# Altium schematic sheet Power_Input_5V.SchDoc: 01 - Entrada protegida e fonte digital
size A3; Project: CM5 Photonic Bias Controller; DocumentRev: R5; ProjectRev: R5; Version: Rev R6; SheetNumber: 2; SheetTotal: 17; Author: Carlos Renan; SCH_SCALE: N/A; Address1: UFCG; Address2: Referencia: VIRTUS CC; Address3: Campina Grande - PB; ProjectName: Controle automatico de BIAS para MZM/IQ - Projeto 3; DocumentName: Power_Input_5V.SchDoc
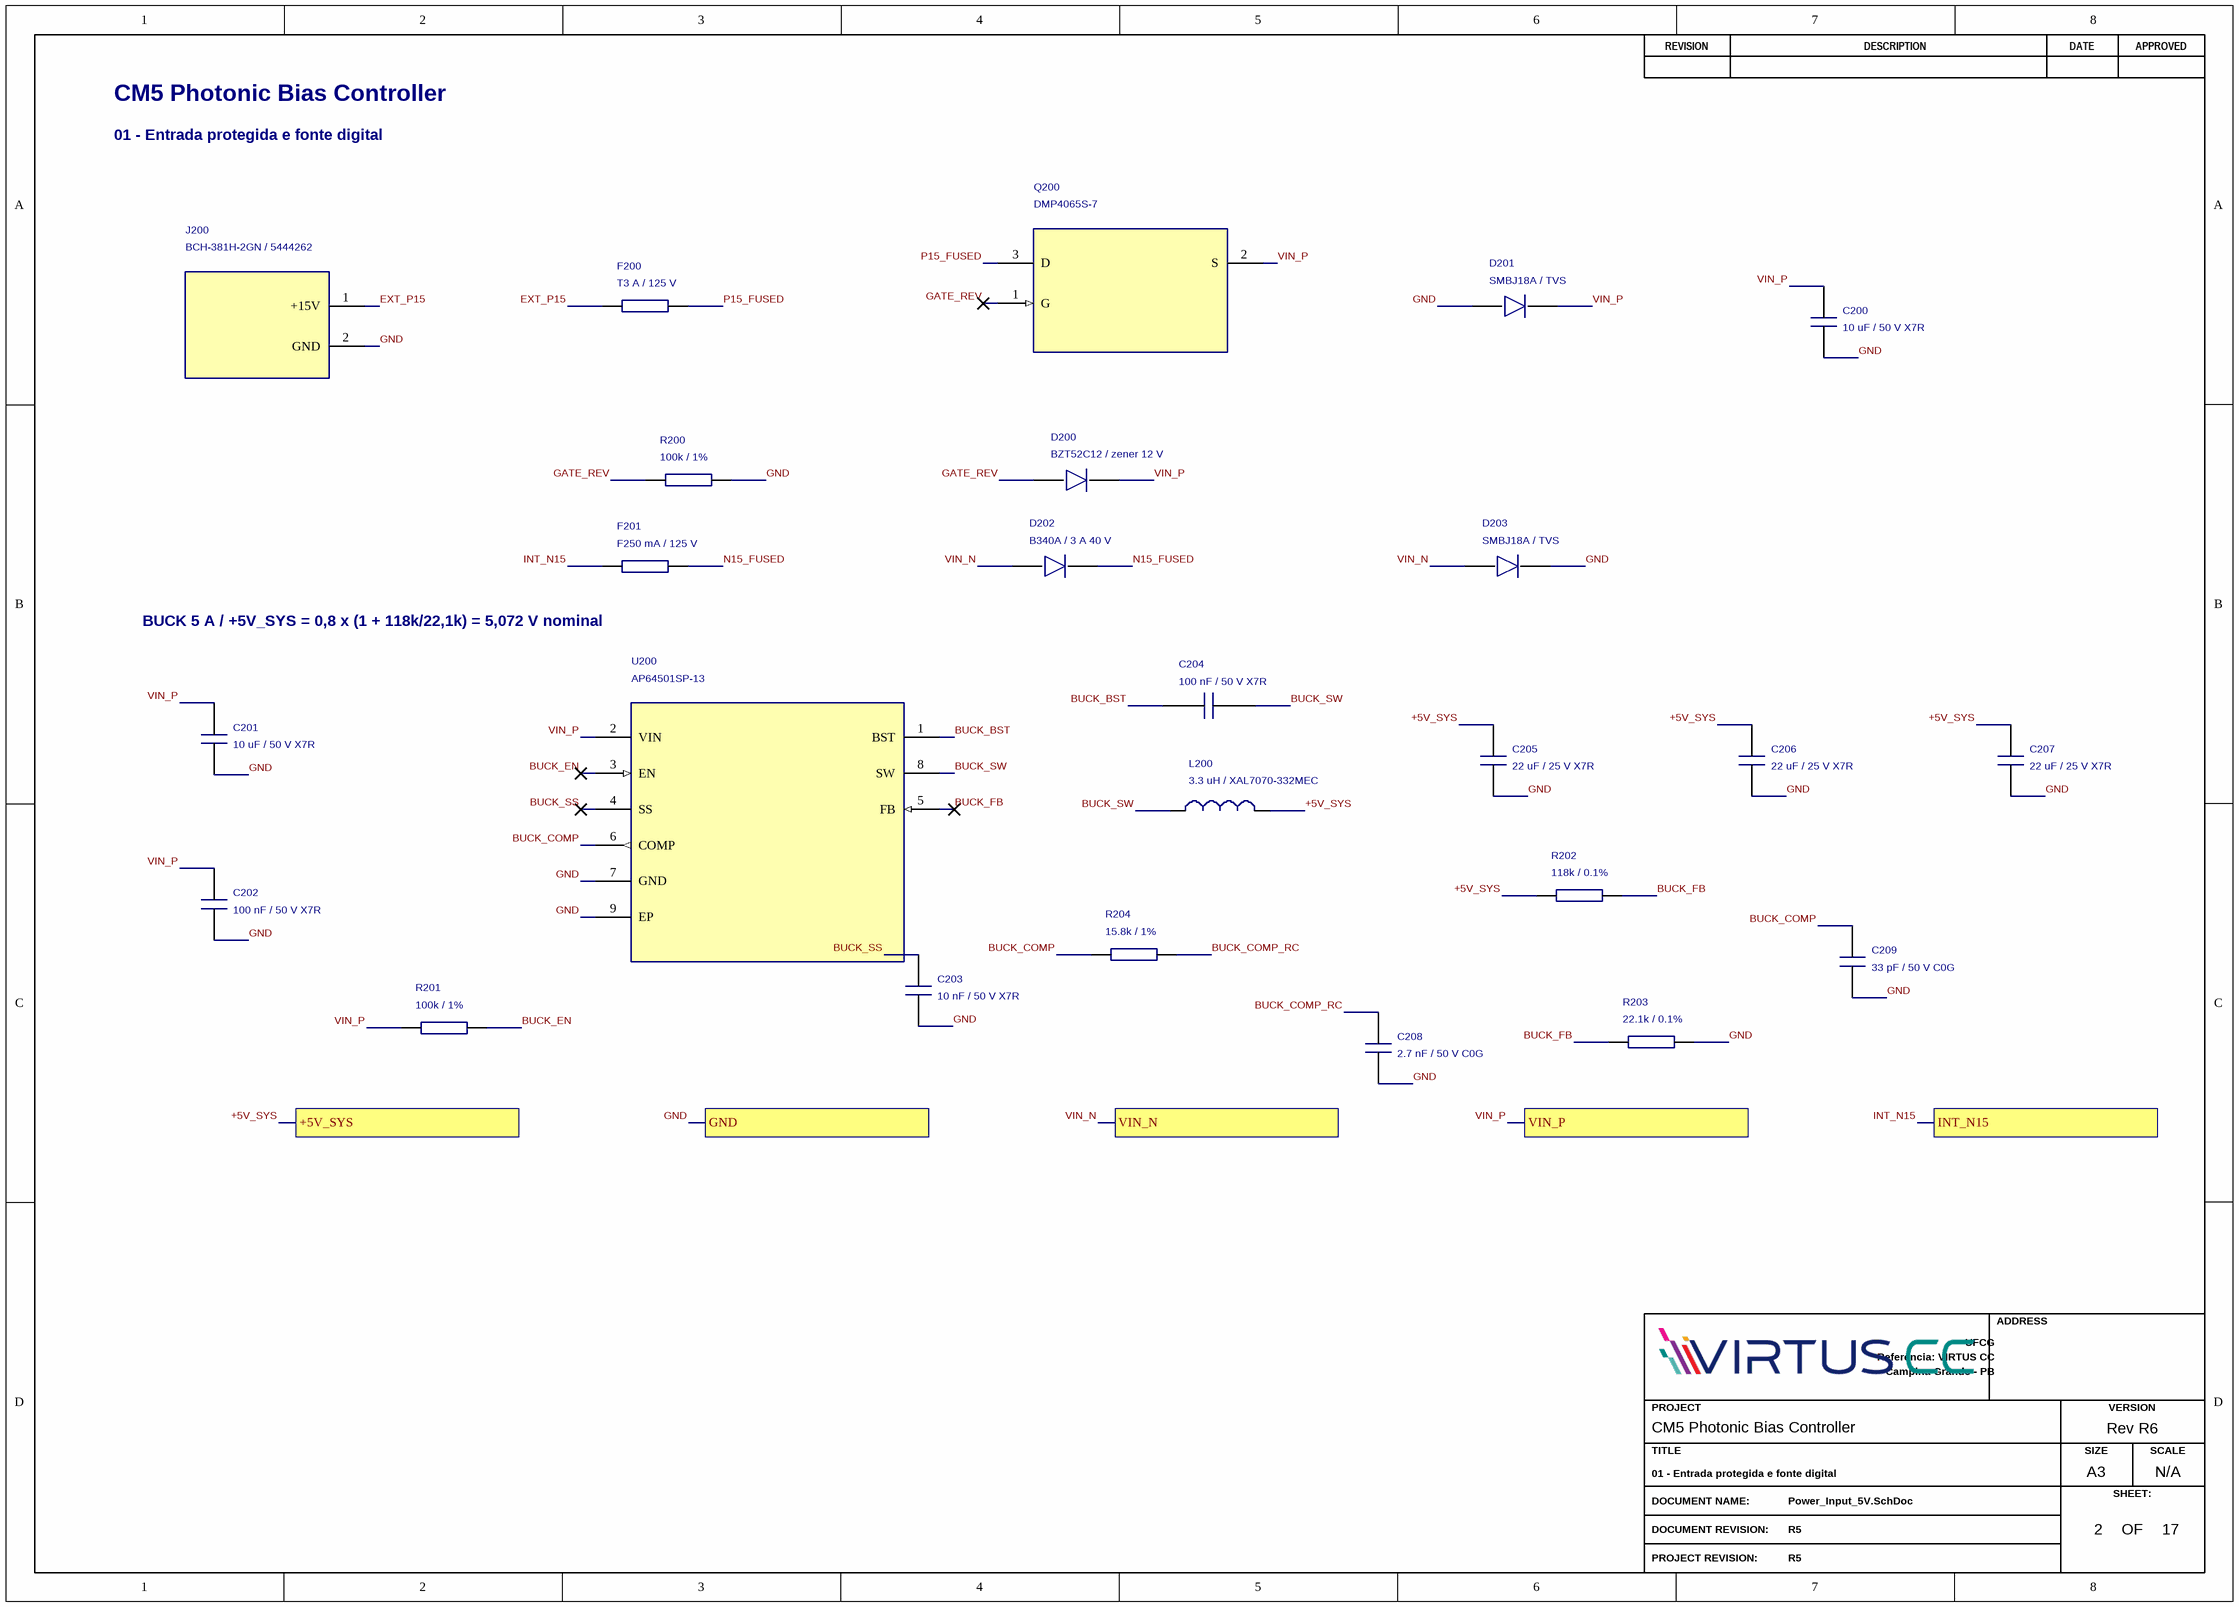
[diagram p0: Power_Input_5V.SchDoc]

## Parts
C200  10 uF / 50 V X7R  [C1210]
C201  10 uF / 50 V X7R  [C1210]
C202  100 nF / 50 V X7R  [C0805]
C203  10 nF / 50 V X7R  [C0805]
C204  100 nF / 50 V X7R  [C0805]
C205  22 uF / 25 V X7R  [C1210]
C206  22 uF / 25 V X7R  [C1210]
C207  22 uF / 25 V X7R  [C1210]
C208  2.7 nF / 50 V C0G  [C0805]
C209  33 pF / 50 V C0G  [C0805]
D200  BZT52C12 / zener 12 V  [SOD-123]
D201  SMBJ18A / TVS  [DO-214AA]
D202  B340A / 3 A 40 V  [DO-214AC]
D203  SMBJ18A / TVS  [DO-214AA]
F200  T3 A / 125 V  [FUSE_NANO2]
F201  F250 mA / 125 V  [FUSE_NANO2]
J200  BCH-381H-2GN / 5444262  [5444262]
L200  3.3 uH / XAL7070-332MEC  [XAL7070]
Q200  DMP4065S-7  [ONSC-SOT-23-3-318-08_V]
R200  100k / 1%  [R-0603]
R201  100k / 1%  [R-0603]
R202  118k / 0.1%  [R-0603]
R203  22.1k / 0.1%  [R-0603]
R204  15.8k / 1%  [R-0603]
U200  AP64501SP-13  [AP64501_SO8EP]

## Ports
+5V_SYS, GND, INT_N15, VIN_N, VIN_P

## Nets
+5V_SYS: C205.1 C206.1 C207.1 L200.2 R202.1 ; port +5V_SYS
BUCK_BST: C204.1 U200.1(BST)
BUCK_COMP: C209.1 R204.1 U200.6(COMP)
BUCK_COMP_RC: C208.1 R204.2
BUCK_EN: R201.2 U200.3(EN)
BUCK_FB: R202.2 R203.1 U200.5(FB)
BUCK_SS: C203.1 U200.4(SS)
BUCK_SW: C204.2 L200.1 U200.8(SW)
EXT_P15: F200.1 J200.1(+15V)
GATE_REV: D200.2(A) Q200.1(G) R200.1
GND: C200.2 C201.2 C202.2 C203.2 C205.2 C206.2 C207.2 C208.2 C209.2 D201.2(A) D203.1(K) J200.2(GND) R200.2 R203.2 U200.7(GND) U200.9(EP) ; port GND
INT_N15: F201.1 ; port INT_N15
N15_FUSED: D202.1(K) F201.2
P15_FUSED: F200.2 Q200.3(D)
VIN_N: D202.2(A) D203.2(A) ; port VIN_N
VIN_P: C200.1 C201.1 C202.1 D200.1(K) D201.1(K) Q200.2(S) R201.1 U200.2(VIN) ; port VIN_P

## Notes on the sheet
- CM5 Photonic Bias Controller
- 01 - Entrada protegida e fonte digital
- (near F201) BUCK 5 A / +5V_SYS = 0,8 x (1 + 118k/22,1k) = 5,072 V nominal
- REVISION
- DESCRIPTION
- DATE
- APPROVED
- ADDRESS
- PROJECT
- VERSION
- TITLE
- A3
- SIZE
- SCALE
- DOCUMENT NAME:
- DOCUMENT REVISION:
- OF
- SHEET:
- PROJECT REVISION:

## Library data of the parts
C200 = 22 uF: Manufacturer: KEMET; Manufacturer Part Number: C1210C106K5RACTU; Review: 10 uF/50 V + C201 de 10 uF substituem a combinacao generica 22+10 uF na entrada; verificar ripple/inrush.; Procurement Status: Busca por MPN; SKU e disponibilidade a confirmar; BOM Purchase: Yes; Manufacturer 1: KEMET; Manufacturer Part Number 1: C1210C106K5RACTU; Supplier 1: DigiKey; Supplier URL 1: https://www.digikey.com.br/pt/products/result?keywords=C1210C106K5RACTU; Supplier 2: Mouser; Supplier URL 2: https://br.mouser.com/c/?q=C1210C106K5RACTU; Datasheet: https://www.yageogroup.com/download/specsheet/C1210C106K5RACTU
C201 = 10 uF: Manufacturer: KEMET; Manufacturer Part Number: C1210C106K5RACTU; Procurement Status: Busca por MPN; SKU e disponibilidade a confirmar; BOM Purchase: Yes; Manufacturer 1: KEMET; Manufacturer Part Number 1: C1210C106K5RACTU; Supplier 1: DigiKey; Supplier URL 1: https://www.digikey.com.br/pt/products/result?keywords=C1210C106K5RACTU; Supplier 2: Mouser; Supplier URL 2: https://br.mouser.com/c/?q=C1210C106K5RACTU; Datasheet: https://www.yageogroup.com/download/specsheet/C1210C106K5RACTU
C202 C204 = 100 nF: Manufacturer: KEMET; Manufacturer Part Number: C0805C104K5RACTU; Procurement Status: Busca por MPN; SKU e disponibilidade a confirmar; BOM Purchase: Yes; Manufacturer 1: KEMET; Manufacturer Part Number 1: C0805C104K5RACTU; Supplier 1: DigiKey; Supplier URL 1: https://www.digikey.com.br/pt/products/result?keywords=C0805C104K5RACTU; Supplier 2: Mouser; Supplier URL 2: https://br.mouser.com/c/?q=C0805C104K5RACTU; Datasheet: https://www.yageogroup.com/download/specsheet/C0805C104K5RACTU
C203 = 10 nF: Manufacturer: KEMET; Manufacturer Part Number: C0805C103K5RACTU; Procurement Status: Busca por MPN; SKU e disponibilidade a confirmar; BOM Purchase: Yes; Manufacturer 1: KEMET; Manufacturer Part Number 1: C0805C103K5RACTU; Supplier 1: DigiKey; Supplier URL 1: https://www.digikey.com.br/pt/products/result?keywords=C0805C103K5RACTU; Supplier 2: Mouser; Supplier URL 2: https://br.mouser.com/c/?q=C0805C103K5RACTU; Datasheet: https://www.yageogroup.com/download/specsheet/C0805C103K5RACTU
C205-C207 = 22 uF: Manufacturer: KEMET; Manufacturer Part Number: C1210C226K3RACTU; Review: Confirmar curva DC-bias: meta de >=50 uF efetivos no conjunto a 5,1 V; compensacao do buck ainda requer ensaio.; Procurement Status: SKU conferido; consultar disponibilidade; BOM Purchase: Yes; Manufacturer 1: KEMET; Manufacturer Part Number 1: C1210C226K3RACTU; Supplier 1: DigiKey; Supplier Part Number 1: 399-C1210C226K3RACTUCT-ND; Supplier URL 1: https://www.digikey.com/en/products/detail/kemet/C1210C226K3RACTU/5267618; Supplier 2: Mouser; Supplier URL 2: https://br.mouser.com/c/?q=C1210C226K3RACTU; Datasheet: https://www.yageogroup.com/download/specsheet/C1210C226K3RACTU
C208 = 2.7 nF: Manufacturer: KEMET; Manufacturer Part Number: C0805C272J5GACTU; Procurement Status: Busca por MPN; SKU e disponibilidade a confirmar; BOM Purchase: Yes; Manufacturer 1: KEMET; Manufacturer Part Number 1: C0805C272J5GACTU; Supplier 1: DigiKey; Supplier URL 1: https://www.digikey.com.br/pt/products/result?keywords=C0805C272J5GACTU; Supplier 2: Mouser; Supplier URL 2: https://br.mouser.com/c/?q=C0805C272J5GACTU; Datasheet: https://www.yageogroup.com/download/specsheet/C0805C272J5GACTU
C209 = 33 pF: Manufacturer: KEMET; Manufacturer Part Number: C0805C330J5GACTU; Procurement Status: Busca por MPN; SKU e disponibilidade a confirmar; BOM Purchase: Yes; Manufacturer 1: KEMET; Manufacturer Part Number 1: C0805C330J5GACTU; Supplier 1: DigiKey; Supplier URL 1: https://www.digikey.com.br/pt/products/result?keywords=C0805C330J5GACTU; Supplier 2: Mouser; Supplier URL 2: https://br.mouser.com/c/?q=C0805C330J5GACTU; Datasheet: https://www.yageogroup.com/download/specsheet/C0805C330J5GACTU
D200 = BZT52C12: Manufacturer: Diodes Incorporated; Manufacturer Part Number: BZT52C12-7-F; Procurement Status: Busca por MPN; SKU e disponibilidade a confirmar; BOM Purchase: Yes; Manufacturer 1: Diodes Incorporated; Manufacturer Part Number 1: BZT52C12-7-F; Supplier 1: DigiKey; Supplier URL 1: https://www.digikey.com.br/pt/products/result?keywords=BZT52C12-7-F; Supplier 2: Mouser; Supplier URL 2: https://br.mouser.com/c/?q=BZT52C12-7-F; Datasheet: https://www.diodes.com/datasheet/download/BZT52C2V4.pdf
D201 D203 = SMBJ18A: Manufacturer: Diodes Incorporated; Manufacturer Part Number: SMBJ18A-13-F; Procurement Status: Busca por MPN; SKU e disponibilidade a confirmar; BOM Purchase: Yes; Manufacturer 1: Diodes Incorporated; Manufacturer Part Number 1: SMBJ18A-13-F; Supplier 1: DigiKey; Supplier URL 1: https://www.digikey.com.br/pt/products/result?keywords=SMBJ18A-13-F; Supplier 2: Mouser; Supplier URL 2: https://br.mouser.com/c/?q=SMBJ18A-13-F; Datasheet: https://www.diodes.com/datasheet/download/SMBJ5.0A.pdf
D202 = SS34: Manufacturer: Diodes Incorporated; Manufacturer Part Number: B340A-13-F; Review: Substitui SS34 generico; encapsulamento SMA definido pelo fabricante.; Procurement Status: Busca por MPN; SKU e disponibilidade a confirmar; BOM Purchase: Yes; Manufacturer 1: Diodes Incorporated; Manufacturer Part Number 1: B340A-13-F; Supplier 1: DigiKey; Supplier URL 1: https://www.digikey.com.br/pt/products/result?keywords=B340A-13-F; Supplier 2: Mouser; Supplier URL 2: https://br.mouser.com/c/?q=B340A-13-F; Datasheet: https://www.diodes.com/datasheet/download/B340A.pdf
F200 = T3.15A: Manufacturer: Littelfuse; Manufacturer Part Number: 0452003.MRL; Review: 3 A lento no lugar do 3,15 A generico. Verificar inrush e coordenacao com fonte de bancada.; Procurement Status: SKU conferido; consultar disponibilidade; BOM Purchase: Yes; Manufacturer 1: Littelfuse; Manufacturer Part Number 1: 0452003.MRL; Supplier 1: DigiKey; Supplier Part Number 1: F2604CT-ND; Supplier URL 1: https://www.digikey.com/en/products/detail/littelfuse-inc/0452003-MRL/700840; Supplier 2: Mouser; Supplier URL 2: https://br.mouser.com/c/?q=0452003.MRL; Datasheet: https://www.littelfuse.com/~/media/electronics/datasheets/fuses/littelfuse_fuse_452_454_datasheet.pdf.pdf
F201 = Fusivel T250mA: Manufacturer: Littelfuse; Manufacturer Part Number: 0451.250MRL; Review: 250 mA rapido; a serie 452 nao oferece 250 mA. Validar pulso de partida do ramo negativo.; Procurement Status: SKU conferido; consultar disponibilidade; BOM Purchase: Yes; Manufacturer 1: Littelfuse; Manufacturer Part Number 1: 0451.250MRL; Supplier 1: DigiKey; Supplier Part Number 1: F2572CT-ND; Supplier URL 1: https://www.digikey.com/en/products/detail/littelfuse-inc/0451-250MRL/700810; Supplier 2: Mouser; Supplier URL 2: https://br.mouser.com/c/?q=0451.250MRL; Datasheet: https://www.littelfuse.com/~/media/electronics/datasheets/fuses/littelfuse_fuse_451_453_datasheet.pdf.pdf
J200 = Borne 2 vias: Manufacturer: Phoenix Contact; Procurement Status: Busca por MPN; SKU e disponibilidade a confirmar; BOM Purchase: Yes; Manufacturer Part Number: 5444262; Manufacturer 1: Phoenix Contact; Manufacturer Part Number 1: 5444262; Supplier 1: DigiKey; Supplier URL 1: https://www.digikey.com.br/pt/products/result?keywords=5444262; Supplier 2: Mouser; Supplier URL 2: https://br.mouser.com/c/?q=5444262; Datasheet: https://www.phoenixcontact.com/en-ie/products/pcb-header-bch-381h-2-gn-5444262
L200 = 3.3 uH: Manufacturer: Coilcraft; Review: 3,3 uH +/-20%; DCR max 9,42 mOhm; Isat 19,4 A (queda 30%); verificar compensacao e termica do buck.; Procurement Status: Busca por MPN; SKU e disponibilidade a confirmar; BOM Purchase: Yes; Manufacturer Part Number: XAL7070-332MEC; Manufacturer 1: Coilcraft; Manufacturer Part Number 1: XAL7070-332MEC; Supplier 1: DigiKey; Supplier URL 1: https://www.digikey.com.br/pt/products/result?keywords=XAL7070-332MEC; Supplier 2: Mouser; Supplier URL 2: https://br.mouser.com/c/?q=XAL7070-332MEC; Datasheet: https://www.coilcraft.com/getmedia/1ba55433-bcc8-4838-9b21-382f497e12e0/xal7070.pdf
Q200 = DMP4065S-7: Manufacturer: Diodes Incorporated; Procurement Status: Busca por MPN; SKU e disponibilidade a confirmar; BOM Purchase: Yes; Manufacturer Part Number: DMP4065S-7; Manufacturer 1: Diodes Incorporated; Manufacturer Part Number 1: DMP4065S-7; Supplier 1: DigiKey; Supplier URL 1: https://www.digikey.com.br/pt/products/result?keywords=DMP4065S-7; Supplier 2: Mouser; Supplier URL 2: https://br.mouser.com/c/?q=DMP4065S-7; Datasheet: https://www.diodes.com/datasheet/download/DMP4065S.pdf
R200 R201 = 100k: Manufacturer: YAGEO; Manufacturer Part Number: RC0603FR-07100KL; Procurement Status: Busca por MPN; SKU e disponibilidade a confirmar; BOM Purchase: Yes; Manufacturer 1: YAGEO; Manufacturer Part Number 1: RC0603FR-07100KL; Supplier 1: DigiKey; Supplier URL 1: https://www.digikey.com.br/pt/products/result?keywords=RC0603FR-07100KL; Supplier 2: Mouser; Supplier URL 2: https://br.mouser.com/c/?q=RC0603FR-07100KL; Datasheet: https://www.yageo.com/en/Product/Index/rchip
R202 = 118k: Manufacturer: YAGEO; Manufacturer Part Number: RT0603BRD07118KL; Review: Filme fino, 0,1%, 25 ppm/K; 0,1 W. Verificar dissipacao em R210/R212 e matching dos drivers.; Procurement Status: Busca por MPN; SKU e disponibilidade a confirmar; BOM Purchase: Yes; Manufacturer 1: YAGEO; Manufacturer Part Number 1: RT0603BRD07118KL; Supplier 1: DigiKey; Supplier URL 1: https://www.digikey.com.br/pt/products/result?keywords=RT0603BRD07118KL; Supplier 2: Mouser; Supplier URL 2: https://br.mouser.com/c/?q=RT0603BRD07118KL; Datasheet: https://www.yageo.com/en/Product/Index/rchip
R203 = 22.1k: Manufacturer: YAGEO; Manufacturer Part Number: RT0603BRD0722K1L; Review: Filme fino, 0,1%, 25 ppm/K; 0,1 W. Verificar dissipacao em R210/R212 e matching dos drivers.; Procurement Status: Busca por MPN; SKU e disponibilidade a confirmar; BOM Purchase: Yes; Manufacturer 1: YAGEO; Manufacturer Part Number 1: RT0603BRD0722K1L; Supplier 1: DigiKey; Supplier URL 1: https://www.digikey.com.br/pt/products/result?keywords=RT0603BRD0722K1L; Supplier 2: Mouser; Supplier URL 2: https://br.mouser.com/c/?q=RT0603BRD0722K1L; Datasheet: https://www.yageo.com/en/Product/Index/rchip
R204 = 15.8k: Manufacturer: YAGEO; Manufacturer Part Number: RC0603FR-0715K8L; Procurement Status: Busca por MPN; SKU e disponibilidade a confirmar; BOM Purchase: Yes; Manufacturer 1: YAGEO; Manufacturer Part Number 1: RC0603FR-0715K8L; Supplier 1: DigiKey; Supplier URL 1: https://www.digikey.com.br/pt/products/result?keywords=RC0603FR-0715K8L; Supplier 2: Mouser; Supplier URL 2: https://br.mouser.com/c/?q=RC0603FR-0715K8L; Datasheet: https://www.yageo.com/en/Product/Index/rchip
U200 = AP64501SP-13: Manufacturer: Diodes Incorporated; Procurement Status: Busca por MPN; SKU e disponibilidade a confirmar; BOM Purchase: Yes; Manufacturer Part Number: AP64501SP-13; Manufacturer 1: Diodes Incorporated; Manufacturer Part Number 1: AP64501SP-13; Supplier 1: DigiKey; Supplier URL 1: https://www.digikey.com.br/pt/products/result?keywords=AP64501SP-13; Supplier 2: Mouser; Supplier URL 2: https://br.mouser.com/c/?q=AP64501SP-13; Datasheet: https://www.diodes.com/datasheet/download/AP64501.pdf